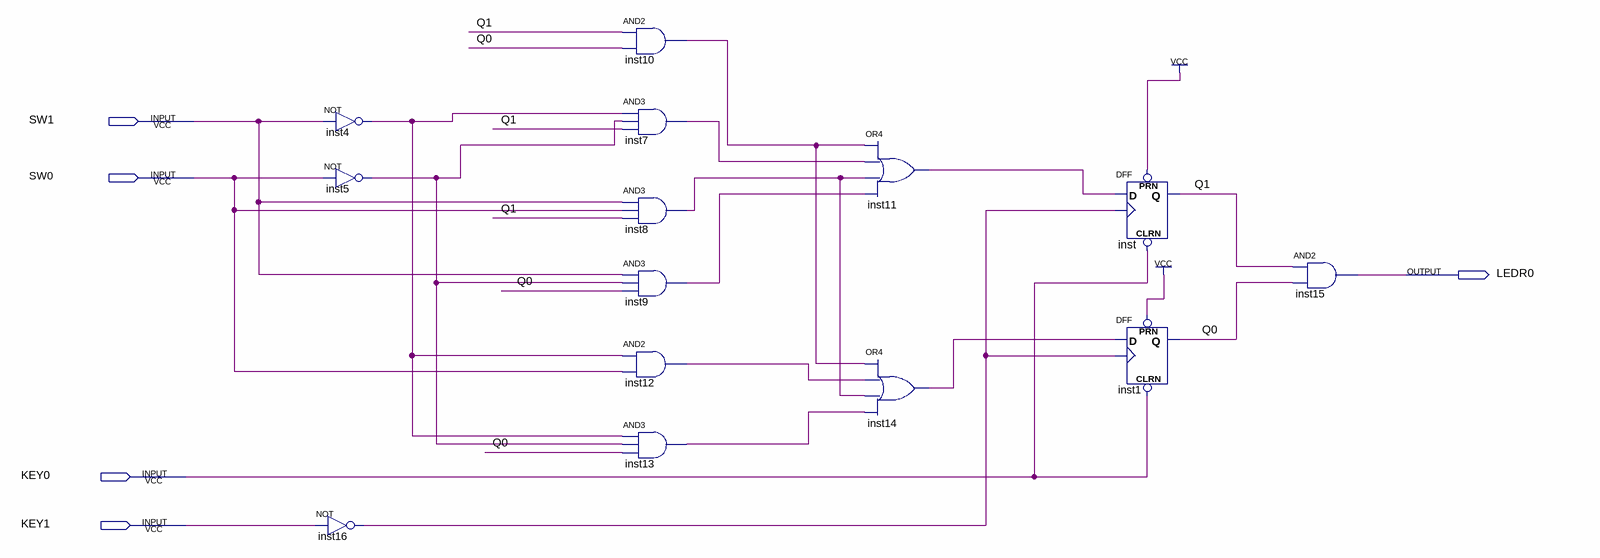
[diagram p0: schematic sheet]
// Quartus schematic Alarme.bdf as structural Verilog: 14 symbols, 5 pins
module Alarme (
  input  SW1,
  input  SW0,
  input  KEY0,
  input  KEY1,
  output LEDR0
);

  wire inst4_out, inst5_out, inst7_out, inst8_out, inst9_out, inst10_out, inst11_out, inst12_out, inst13_out,
       inst14_out, inst16_out, Q0, Q1;

  not inst4 (inst4_out, SW1);
  not inst5 (inst5_out, SW0);
  not inst16 (inst16_out, KEY1);
  and inst10 (inst10_out, Q1, Q0);
  and inst7 (inst7_out, inst4_out, inst5_out, Q1);
  and inst8 (inst8_out, SW1, SW0, Q1);
  and inst9 (inst9_out, SW1, inst5_out, Q0);
  and inst12 (inst12_out, inst4_out, SW0);
  and inst13 (inst13_out, inst4_out, inst5_out, Q0);
  or inst11 (inst11_out, inst10_out, inst7_out, inst8_out, inst9_out);
  or inst14 (inst14_out, inst10_out, inst12_out, inst8_out, inst13_out);
  DFF inst (.CLRN(KEY0), .CLK(inst16_out), .D(inst11_out), .PRN(1'b1), .Q(Q1));
  DFF inst1 (.CLRN(KEY0), .CLK(inst16_out), .D(inst14_out), .PRN(1'b1), .Q(Q0));
  and inst15 (LEDR0, Q1, Q0);
endmodule
